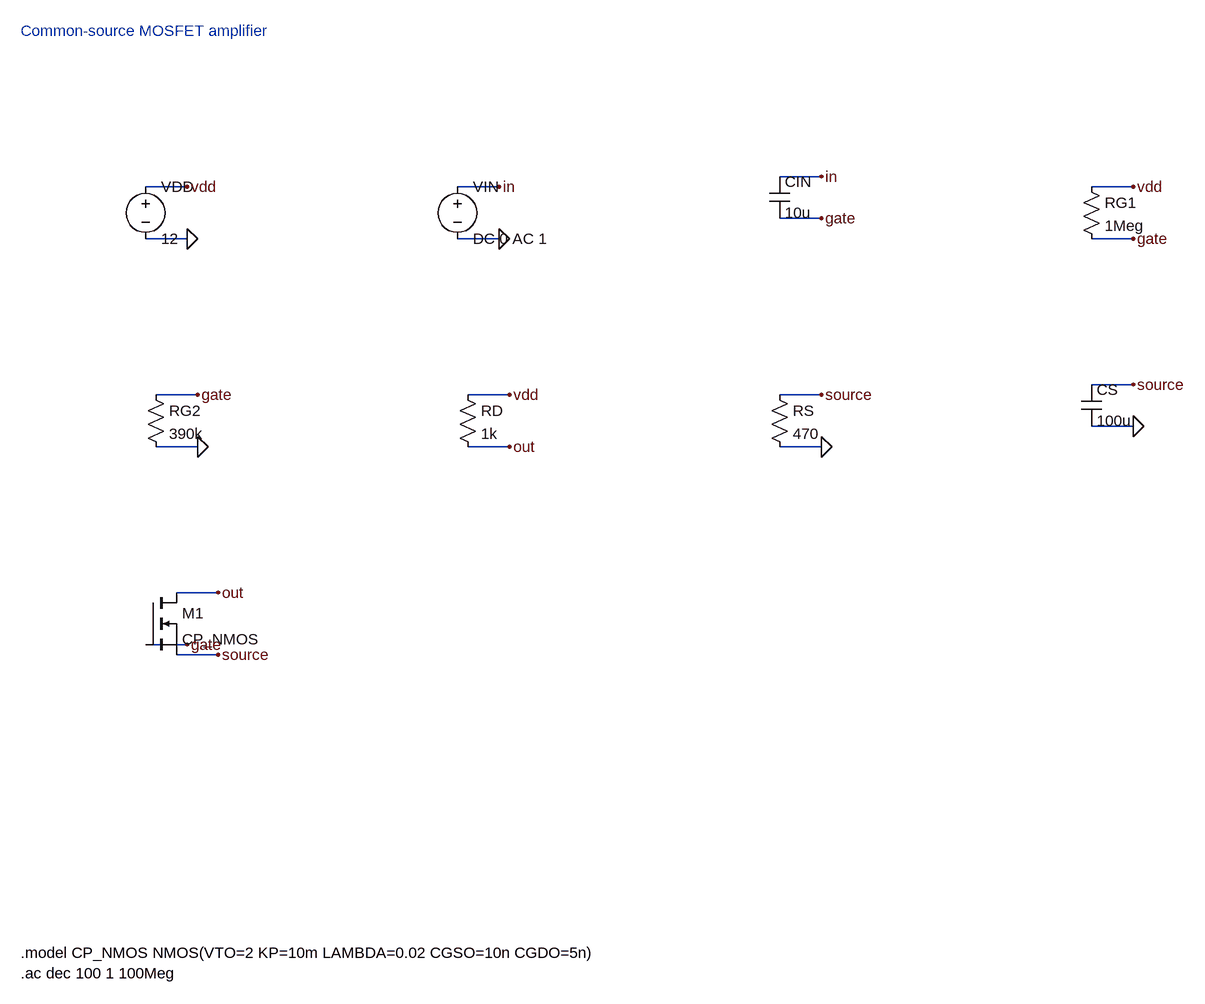
[diagram p0: schematic common-source-mosfet-amplifier.asc]
common-source-mosfet-amplifier.asc, the LTspice schematic file:
Version 4
SHEET 1 2400 2000
TEXT 64 32 Left 2 ;Common-source MOSFET amplifier
SYMBOL voltage 256 256 R0
SYMATTR InstName VDD
SYMATTR Value 12
WIRE 320 272 256 272
FLAG 320 272 vdd
WIRE 320 352 256 352
FLAG 320 352 0
SYMBOL voltage 736 256 R0
SYMATTR InstName VIN
SYMATTR Value DC 0 AC 1
WIRE 800 272 736 272
FLAG 800 272 in
WIRE 800 352 736 352
FLAG 800 352 0
SYMBOL cap 1216 256 R0
SYMATTR InstName CIN
SYMATTR Value 10u
WIRE 1296 256 1232 256
FLAG 1296 256 in
WIRE 1296 320 1232 320
FLAG 1296 320 gate
SYMBOL res 1696 256 R0
SYMATTR InstName RG1
SYMATTR Value 1Meg
WIRE 1776 272 1712 272
FLAG 1776 272 vdd
WIRE 1776 352 1712 352
FLAG 1776 352 gate
SYMBOL res 256 576 R0
SYMATTR InstName RG2
SYMATTR Value 390k
WIRE 336 592 272 592
FLAG 336 592 gate
WIRE 336 672 272 672
FLAG 336 672 0
SYMBOL res 736 576 R0
SYMATTR InstName RD
SYMATTR Value 1k
WIRE 816 592 752 592
FLAG 816 592 vdd
WIRE 816 672 752 672
FLAG 816 672 out
SYMBOL res 1216 576 R0
SYMATTR InstName RS
SYMATTR Value 470
WIRE 1296 592 1232 592
FLAG 1296 592 source
WIRE 1296 672 1232 672
FLAG 1296 672 0
SYMBOL cap 1696 576 R0
SYMATTR InstName CS
SYMATTR Value 100u
WIRE 1776 576 1712 576
FLAG 1776 576 source
WIRE 1776 640 1712 640
FLAG 1776 640 0
SYMBOL nmos 256 896 R0
SYMATTR InstName M1
SYMATTR Value CP_NMOS
SYMATTR SpiceLine W=10u L=1u
WIRE 368 896 304 896
FLAG 368 896 out
WIRE 320 976 256 976
FLAG 320 976 gate
WIRE 368 992 304 992
FLAG 368 992 source
TEXT 64 1450 Left 2 !.model CP_NMOS NMOS(VTO=2 KP=10m LAMBDA=0.02 CGSO=10n CGDO=5n)
TEXT 64 1482 Left 2 !.ac dec 100 1 100Meg

The netlist it stands for:
* common-source-mosfet-amplifier.asc
VDD vdd 0 12
VIN in 0 DC 0 AC 1
CIN in gate 10u
RG1 vdd gate 1Meg
RG2 gate 0 390k
RD vdd out 1k
RS source 0 470
CS source 0 100u
M1 out gate source source CP_NMOS W=10u L=1u
.model NMOS NMOS
.model PMOS PMOS
.lib standard.mos
* Common-source MOSFET amplifier
.model CP_NMOS NMOS(VTO=2 KP=10m LAMBDA=0.02 CGSO=10n CGDO=5n)
.ac dec 100 1 100Meg
.backanno
.end